# Altium schematic sheet Afrodite V11_Final_3K.SchDoc
size A2
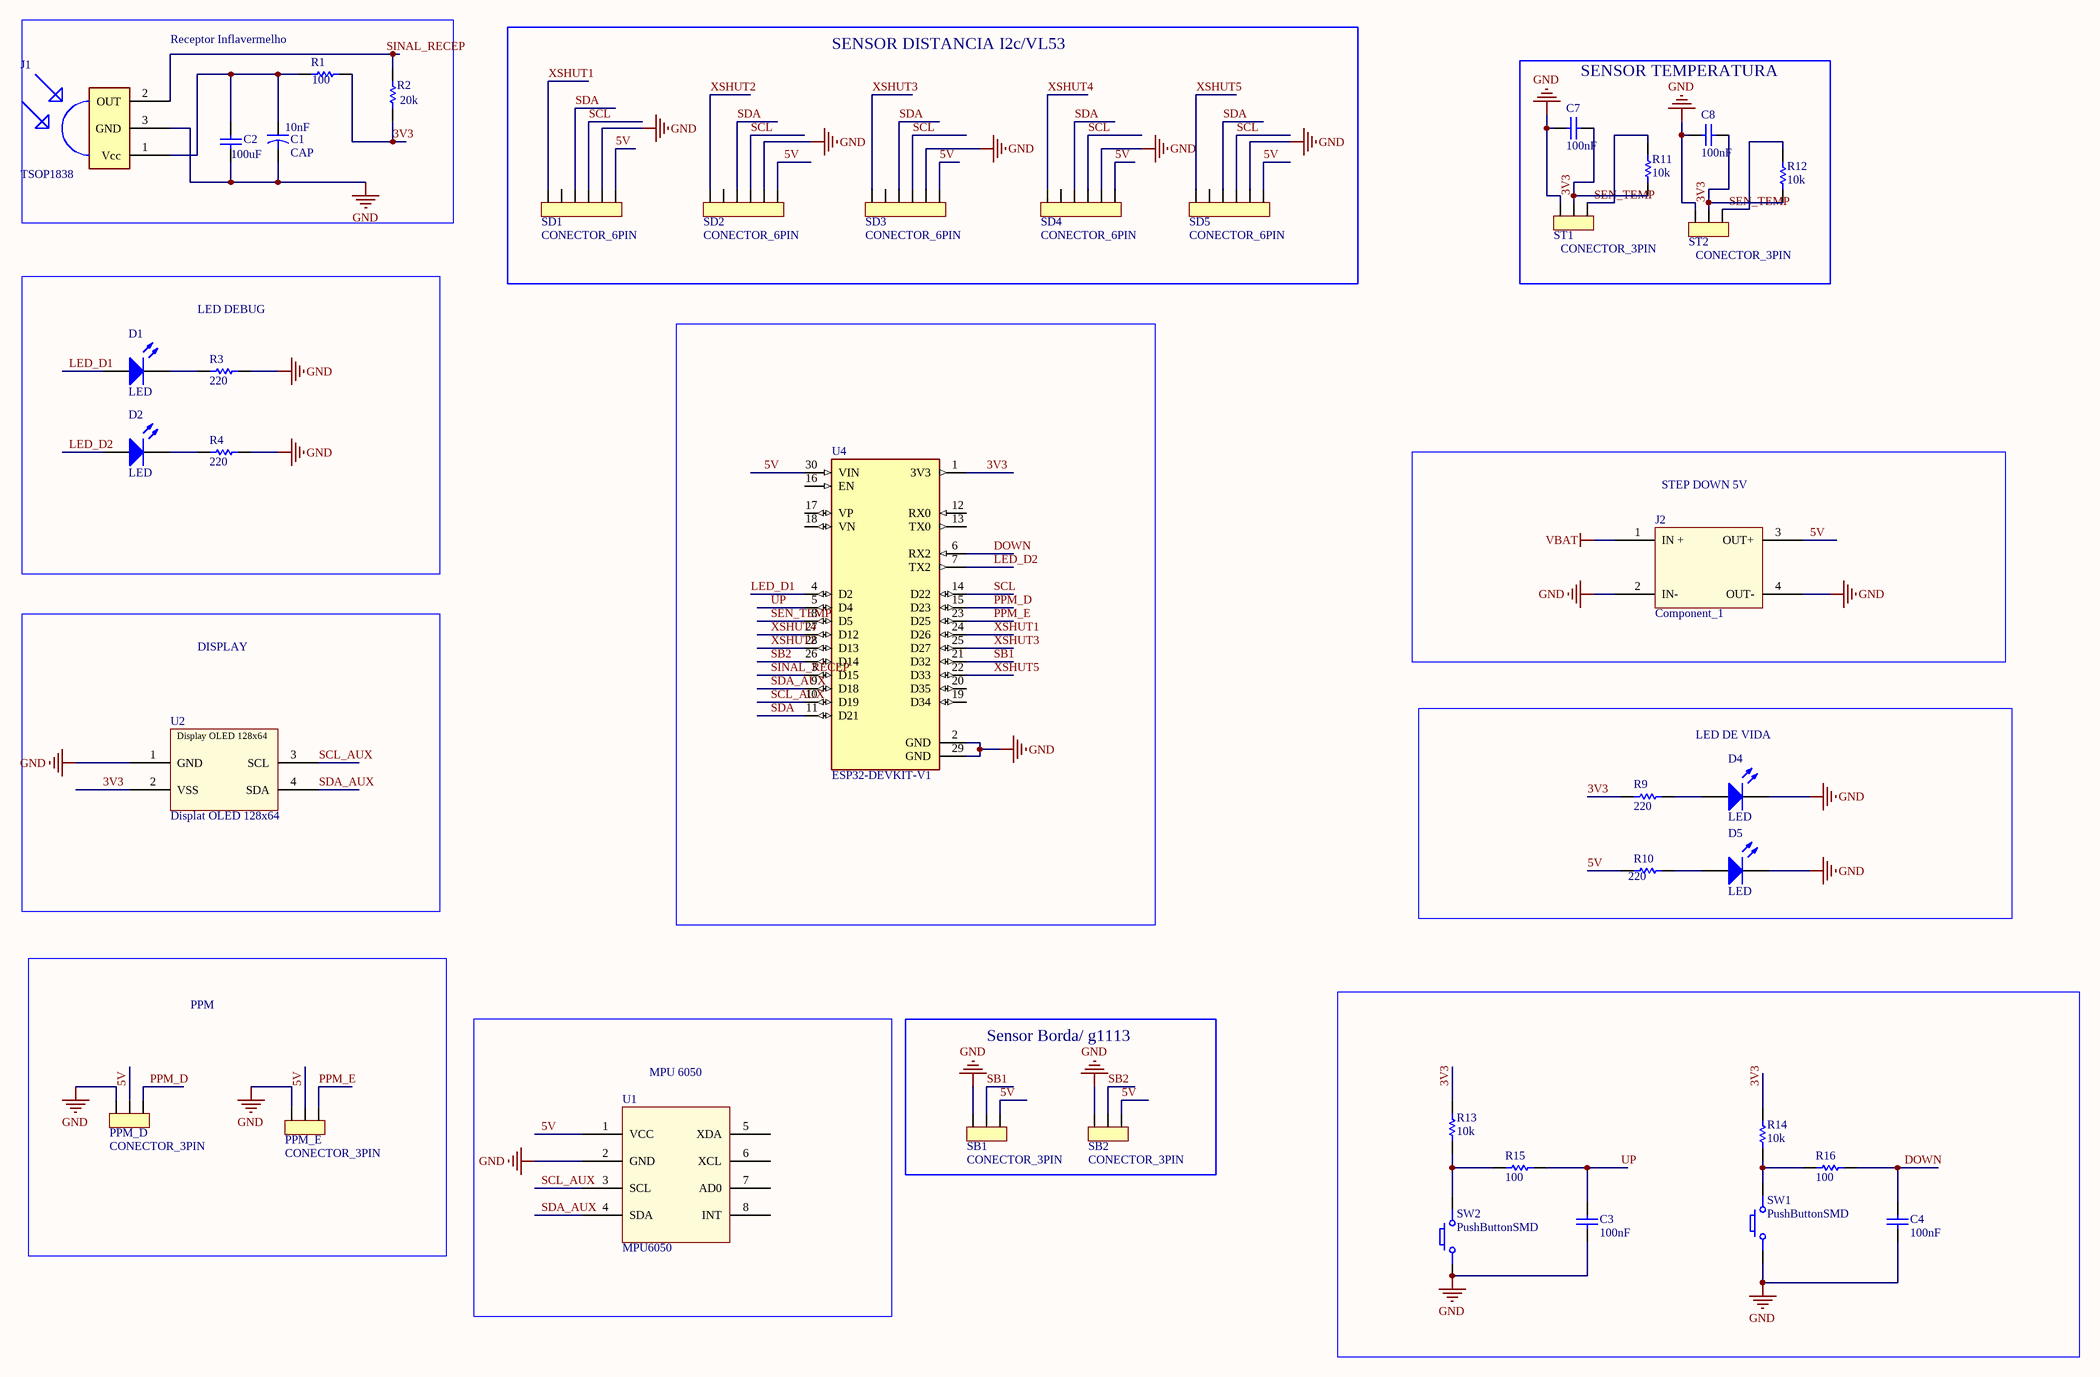
[diagram p0: Afrodite V11_Final_3K.SchDoc]

## Parts
C1  CAP  Valor: 10nF  [CAP ELET .100]
C2  Valor: 100uF  [CAP 0805]  (hidden comment: CAP)
C3  Valor: 100nF  [CAP 0805]  (hidden comment: CAP)
C4  Valor: 100nF  [CAP 0805]  (hidden comment: CAP)
C7  Valor: 100nF  [CAP 0805]  (hidden comment: CAP)
C8  Valor: 100nF  [CAP 0805]  (hidden comment: CAP)
D1  LED  [LED 0805]
D2  LED  [LED 0805]
D4  LED  [LED 0805]
D5  LED  [LED 0805]
J1  TSOP1838  [TSOP18XX]
J2  Component_1  [PCB_LM2596]
PPM_D  CONECTOR_3PIN  [CON3]
PPM_E  CONECTOR_3PIN  [CON3]
R1  value 100  [RES 0805]  (hidden comment: RESISTOR)
R2  value 20k  [RES 0805]  (hidden comment: RESISTOR)
R3  value 220  [RES 0805]  (hidden comment: RESISTOR)
R4  value 220  [RES 0805]  (hidden comment: RESISTOR)
R9  value 220  [RES 0805]  (hidden comment: RESISTOR)
R10  value 220  [RES 0805]  (hidden comment: RESISTOR)
R11  value 10k  [RES 0805]  (hidden comment: RESISTOR)
R12  value 10k  [RES 0805]  (hidden comment: RESISTOR)
R13  value 10k  [RES 0805]  (hidden comment: RESISTOR)
R14  value 10k  [RES 0805]  (hidden comment: RESISTOR)
R15  value 100  [RES 0805]  (hidden comment: RESISTOR)
R16  value 100  [RES 0805]  (hidden comment: RESISTOR)
SB1  CONECTOR_3PIN  [CON3]
SB2  CONECTOR_3PIN  [CON3]
SD1  CONECTOR_6PIN  [CON6]
SD2  CONECTOR_6PIN  [CON6]
SD3  CONECTOR_6PIN  [CON6]
SD4  CONECTOR_6PIN  [CON6]
SD5  CONECTOR_6PIN  [CON6]
ST1  CONECTOR_3PIN  [CON3]
ST2  CONECTOR_3PIN  [CON3]
SW1  PushButtonSMD  [PUSHBUTTON.SMD]
SW2  PushButtonSMD  [PUSHBUTTON.SMD]
U1  value MPU6050  [mpu6050]  (hidden comment: Sensor giroscopio acelerometro)
U2  Displat OLED 128x64  [Display OLED]
U4  ESP32-DEVKIT-V1  [MODULE_ESP32_DEVKIT_V1]

## Blocks framed on the sheet
Receptor Inflavermelho: C1 C2 J1 R1 R2
SENSOR DISTANCIA I2c/VL53: SD1-SD5
SENSOR TEMPERATURA: C7 C8 R11 R12 ST1 ST2
LED DEBUG: D1 D2 R3 R4
STEP DOWN 5V: J2
DISPLAY: U2
LED DE VIDA: D4 D5 R9 R10
PPM: PPM_D PPM_E
MPU 6050: U1
Sensor Borda/ g1113: SB1 SB2

## Nets
GND: C1.1 C2.1 C3.1 C4.1 C7.2 C8.2 D4.2(K) D5.2(K) J1.3(GND) J2.2(IN-) J2.4(OUT-) PPM_D.1 PPM_E.1 R3.2 R4.2 SB1.1 SB2.1 SD1.5 SD2.5 SD3.5 SD4.5 SD5.5 ST1.1 ST2.1 SW1.1 SW2.1 U1.2(GND) U2.1(GND) U4.2(GND) U4.29(GND)
VBAT: J2.1(IN_+)
3V3: C7.1 C8.1 R1.2 R2.1 R9.1 R11.1 R12.1 R13.2 R14.2 ST1.2 ST2.2 U2.2(VSS) U4.1(3V3)
5V: J2.3(OUT+) PPM_D.2 PPM_E.2 R10.1 SB1.3 SB2.3 SD1.6 SD2.6 SD3.6 SD4.6 SD5.6 U1.1(VCC) U4.30(VIN)
DOWN: C4.2 R16.2 U4.6(RX2)
LED_D1: D1.1(A) U4.4(D2)
LED_D2: D2.1(A) U4.7(TX2)
PPM_D: PPM_D.3 U4.15(D23)
PPM_E: PPM_E.3 U4.23(D25)
SB1: SB1.2 U4.21(D32)
SB2: SB2.2 U4.26(D14)
SCL: SD1.4 SD2.4 SD3.4 SD4.4 SD5.4 U4.14(D22)
SCL_AUX: U1.3(SCL) U2.3(SCL) U4.10(D19)
SDA: SD1.3 SD2.3 SD3.3 SD4.3 SD5.3 U4.11(D21)
SDA_AUX: U1.4(SDA) U2.4(SDA) U4.9(D18)
SEN_TEMP: R11.2 R12.2 ST1.3 ST2.3 U4.8(D5)
SINAL_RECEP: J1.2(OUT) R2.2 U4.3(D15)
UP: C3.2 R15.2 U4.5(D4)
XSHUT1: SD1.1 U4.24(D26)
XSHUT2: SD2.1 U4.28(D13)
XSHUT3: SD3.1 U4.25(D27)
XSHUT4: SD4.1 U4.27(D12)
XSHUT5: SD5.1 U4.22(D33)
NetC1_2: C1.2 C2.2 J1.1(Vcc) R1.1
NetD1_2: D1.2(K) R3.1
NetD2_2: D2.2(K) R4.1
NetD4_1: D4.1(A) R9.2
NetD5_1: D5.1(A) R10.2
NetR13_1: R13.1 R15.1 SW2.2
NetR14_1: R14.1 R16.1 SW1.2

Not connected (* = marked no-connect by the designer): SD1 2; SD2 2; SD3 2; SD4 2; SD5 2; U1 5(XDA) 6(XCL) 7(AD0) 8(INT); U4 12(RX0) 13(TX0) 16(EN) 17(VP) 18(VN) 19(D34) 20(D35)

## Notes on the sheet
- (in symbol Display OLED) Display OLED 128x64

## Library data of the parts
C1 = CAP. ELETROLÍTICO: Capacitor
C2-C4 C7 C8 = CAP. CERÂMICO: Capacitor; Criador por: Luigi Eduardo; Pertence a: Trincabotz; Criado em: 26/06/2012
J1 = TSOP1838: IR Receiver and Demodulator; Value: *; MP: TSOP1838; Package: None; Availability: Unavailable; Price: None
U1 = mpu6050: Sera usado na afrodite
U2 = Display OLED
U4 = ESP32-DEVKIT-V1: Dual core, Wi-Fi: 2.4 GHz up to 150 Mbits/s,BLE (Bluetooth Low Energy) and legacy Bluetooth, 32 bits, Up to 240 MHz; Value: *; MP: ESP32-DEVKIT-V1; Availability: Unavailable; Package: None; Price: None